# Altium schematic sheet FlightController.SchDoc
size A4; SheetNumber: 1; SheetTotal: 1
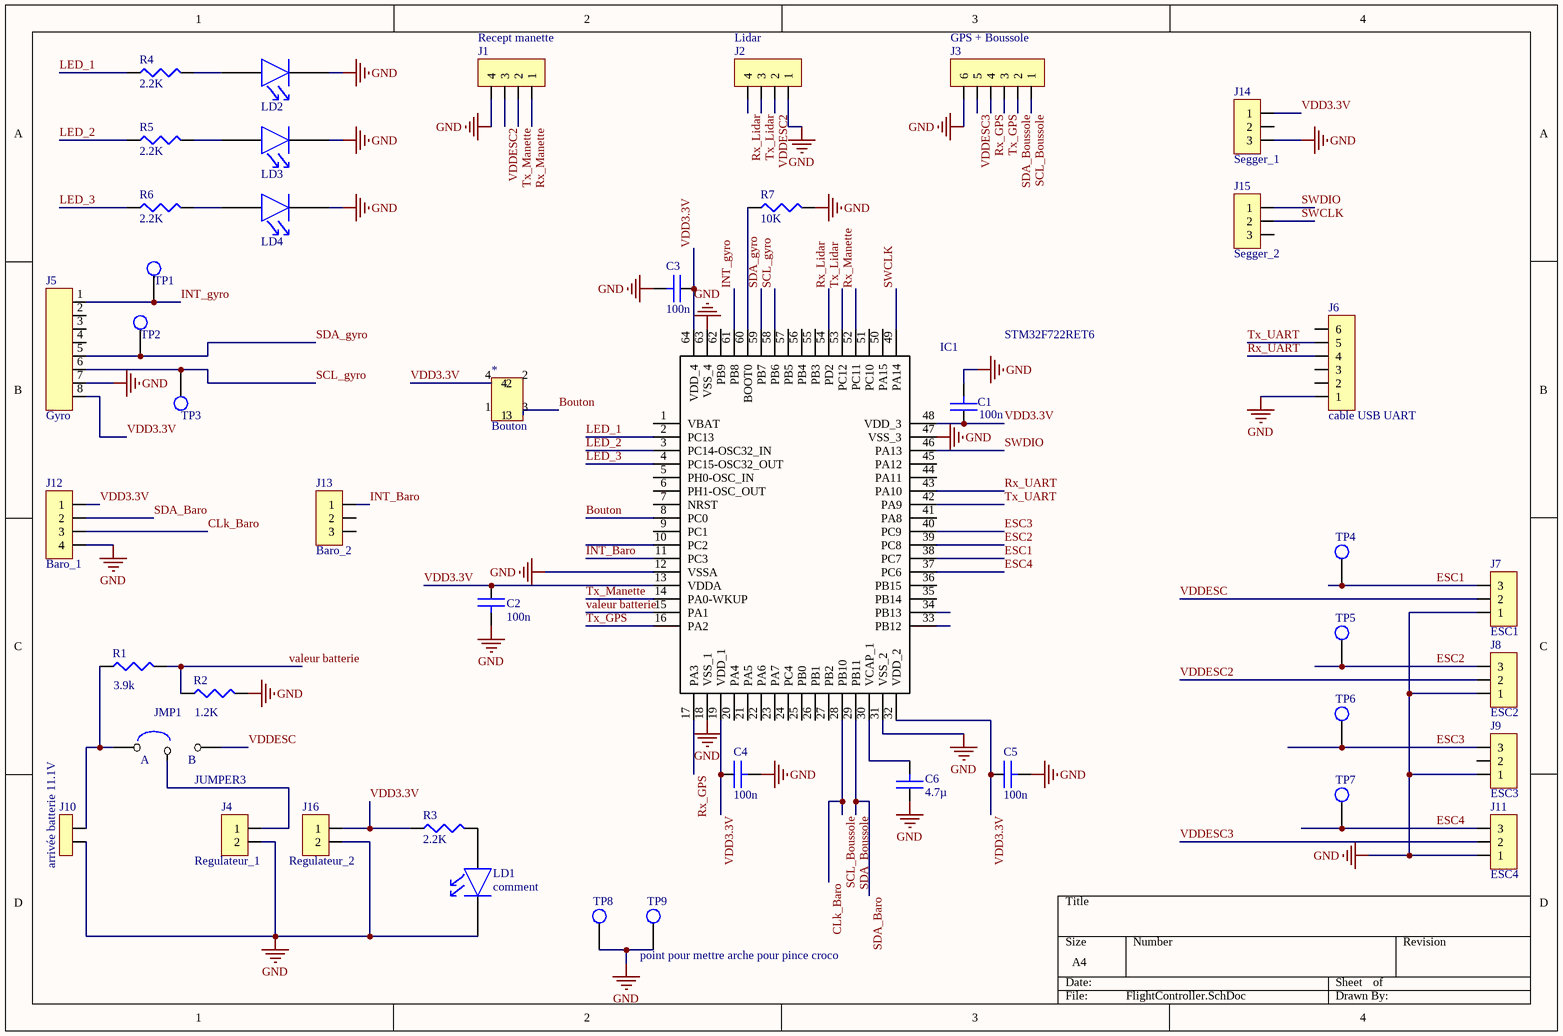
[diagram p0: FlightController.SchDoc]

## Parts
*  Bouton  [PCB_bouton_v2]
C1  value 100n  [0805]  (hidden comment: CAP)
C2  value 100n  [0805]  (hidden comment: CAP)
C3  value 100n  [0805]  (hidden comment: CAP)
C4  value 100n  [0805]  (hidden comment: CAP)
C5  value 100n  [0805]  (hidden comment: CAP)
C6  value 4.7µ  [0805]  (hidden comment: CAP)
IC1  STM32F722RET6  [QFP50P1200X1200X160-64N]
J1  Recept manette  [HEADER4-100-1x4]
J2  Lidar  [HEADER4-100-1x4]
J3  GPS + Boussole  [HEADER6-100-V]
J4  Regulateur_1  [JST-B02B-PASK]
J5  Gyro  [HEADER8-100-1x8]
J6  cable USB UART  [HEADER6-100-V]
J7  ESC1  [HEADER3-100-1x3]
J8  ESC2  [HEADER3-100-1x3]
J9  ESC3  [HEADER3-100-1x3]
J10  arrivée batterie 11.1V  [POWER2]
J11  ESC4  [HEADER3-100-1x3]
J12  Baro_1  [HEADER4-100-1x4]
J13  Baro_2  [HEADER3-100-1x3]
J14  Segger_1  [HEADER3-100-1x3]
J15  Segger_2  [HEADER3-100-1x3]
J16  Regulateur_2  [JST-B02B-PASK]
JMP1  JUMPER3  [JMP3-100]
LD1  comment  [LED0805]
LD2  comment  [LED0805]  (value not drawn)
LD3  comment  [LED0805]  (value not drawn)
LD4  comment  [LED0805]  (value not drawn)
R1  value 3.9k  [0805]  (hidden comment: RES)
R2  value 1.2K  [0805]  (hidden comment: RES)
R3  value 2.2K  [0805]  (hidden comment: RES)
R4  value 2.2K  [0805]  (hidden comment: RES)
R5  value 2.2K  [0805]  (hidden comment: RES)
R6  value 2.2K  [0805]  (hidden comment: RES)
R7  value 10K  [0805]  (hidden comment: RES)
TP1  TESTPOINT  [testpoint2]  (value not drawn)
TP2  TESTPOINT  [testpoint2]  (value not drawn)
TP3  TESTPOINT  [testpoint2]  (value not drawn)
TP4  TESTPOINT  [testpoint2]  (value not drawn)
TP5  TESTPOINT  [testpoint2]  (value not drawn)
TP6  TESTPOINT  [testpoint2]  (value not drawn)
TP7  TESTPOINT  [testpoint2]  (value not drawn)
TP8  TESTPOINT  [testpoint2]  (value not drawn)
TP9  TESTPOINT  [testpoint2]  (value not drawn)

## Nets
GND: C1.2 C2.2 C3.2 C4.2 C5.2 C6.1 IC1.12(VSSA) IC1.18(VSS_1) IC1.31(VSS_2) IC1.47(VSS_3) IC1.63(VSS_4) J1.4 J2.1 J3.6 J4.2 J5.7 J6.1 J7.1 J8.1 J9.1 J10.2 J11.1 J12.4 J14.3 J16.2 LD1.K LD2.K LD3.K LD4.K R2.2 R7.2 TP8.1 TP9.1
Bouton: *.3 IC1.8(PC0)
CLk_Baro: IC1.28(PB10) J3.1 J12.3  [also labelled SCL_Boussole]
ESC1: IC1.38(PC7) J7.3 TP4.1
ESC2: IC1.39(PC8) J8.3 TP5.1
ESC3: IC1.40(PC9) J9.3 TP6.1
ESC4: IC1.37(PC6) J11.3 TP7.1
INT_Baro: IC1.11(PC3) J13.1
INT_gyro: IC1.61(PB8) J5.1 TP1.1
LED_1: IC1.2(PC13) R4.1
LED_2: IC1.3(PC14-OSC32_IN) R5.1
LED_3: IC1.4(PC15-OSC32_OUT) R6.1
Rx_GPS: IC1.17(PA3) J3.4
Rx_Lidar: IC1.54(PD2) J2.4
Rx_Manette: IC1.52(PC11) J1.1
Rx_UART: IC1.43(PA10) J6.4
SCL_gyro: IC1.58(PB6) J5.6 TP3.1
SDA_Baro: IC1.29(PB11) J3.2 J12.2  [also labelled SDA_Boussole]
SDA_gyro: IC1.59(PB7) J5.5 TP2.1
SWCLK: IC1.49(PA14) J15.2
SWDIO: IC1.46(PA13) J15.1
Tx_GPS: IC1.16(PA2) J3.3
Tx_Lidar: IC1.53(PC12) J2.3
Tx_Manette: IC1.14(PA0-WKUP) J1.2
Tx_UART: IC1.42(PA9) J6.5
valeur batterie: IC1.15(PA1) R1.2 R2.1
VDD3.3V: *.4 C1.1 C2.1 C3.1 C4.1 C5.1 IC1.13(VDDA) IC1.19(VDD_1) IC1.32(VDD_2) IC1.48(VDD_3) IC1.64(VDD_4) J5.8 J12.1 J14.1 J16.1 R3.1
VDDESC: J7.2 JMP1.2
VDDESC2: J1.3 J2.2 J8.2
VDDESC3: J3.5 J11.2
NetC6_2: C6.2 IC1.30(VCAP_1)
NetIC1_60: IC1.60(BOOT0) R7.1
NetJ4_1: J4.1 JMP1.3
NetJ10_1: J10.1 JMP1.1 R1.1
NetLD1_A: LD1.A R3.2
NetLD2_A: LD2.A R4.2
NetLD3_A: LD3.A R5.2
NetLD4_A: LD4.A R6.2

Not connected (* = marked no-connect by the designer): * 1 2; IC1 1(VBAT) 5(PH0-OSC_IN) 6(PH1-OSC_OUT) 7(NRST) 9(PC1) 10(PC2) 20(PA4) 21(PA5) 22(PA6) 23(PA7) 24(PC4) 25(PB0) 26(PB1) 27(PB2) 33(PB12) 34(PB13) 35(PB14) 36(PB15) 41(PA8) 44(PA11) 45(PA12) 50(PA15) 51(PC10) 55(PB3) 56(PB4) 57(PB5) 62(PB9); J5 2 3 4; J6 2 3 6; J9 2; J13 2 3; J14 2; J15 3

## Notes on the sheet
- (near TP9) point pour mettre arche pour pince croco
- (in symbol JUMPER3) A; B

## Library data of the parts
C1-C6 = CAP: capacité non polarisée
IC1 = STM32F722RET6: Integrated Circuit; Manufacturer_Name: STMicroelectronics; Datasheet Link: https://www.st.com/resource/en/datasheet/stm32f722ic.pdf; Height: 1.6mm; Manufacturer_Part_Number: STM32F722RET6; Mouser Part Number: 511-STM32F722RET6; Mouser Price/Stock: https://www.mouser.co.uk/ProductDetail/STMicroelectronics/STM32F722RET6?qs=NoqMqJKvPFLRYC3WLxVXLQ%3D%3D; Arrow Part Number: STM32F722RET6; Arrow Price/Stock: https://www.arrow.com/en/products/stm32f722ret6/stmicroelectronics?utm_currency=USD&region=nac
J1 J2 J12 = HEADER4
J3 J6 = HEADER6
J4 J16 = HEADER2
J5 = HEADER8
J7-J9 J11 J13-J15 = HEADER3
J10 = POWER2: connecteur alim 2 pôles
JMP1 = JUMPER3: cavalier 2 positions
LD1-LD4 = LED: LED 5mm/3mm/CMS
R1-R7 = RES: resistance